# Altium schematic sheet 02_Power_Regulations.SchDoc
size A3; SheetNumber: 3; SheetTotal: 12
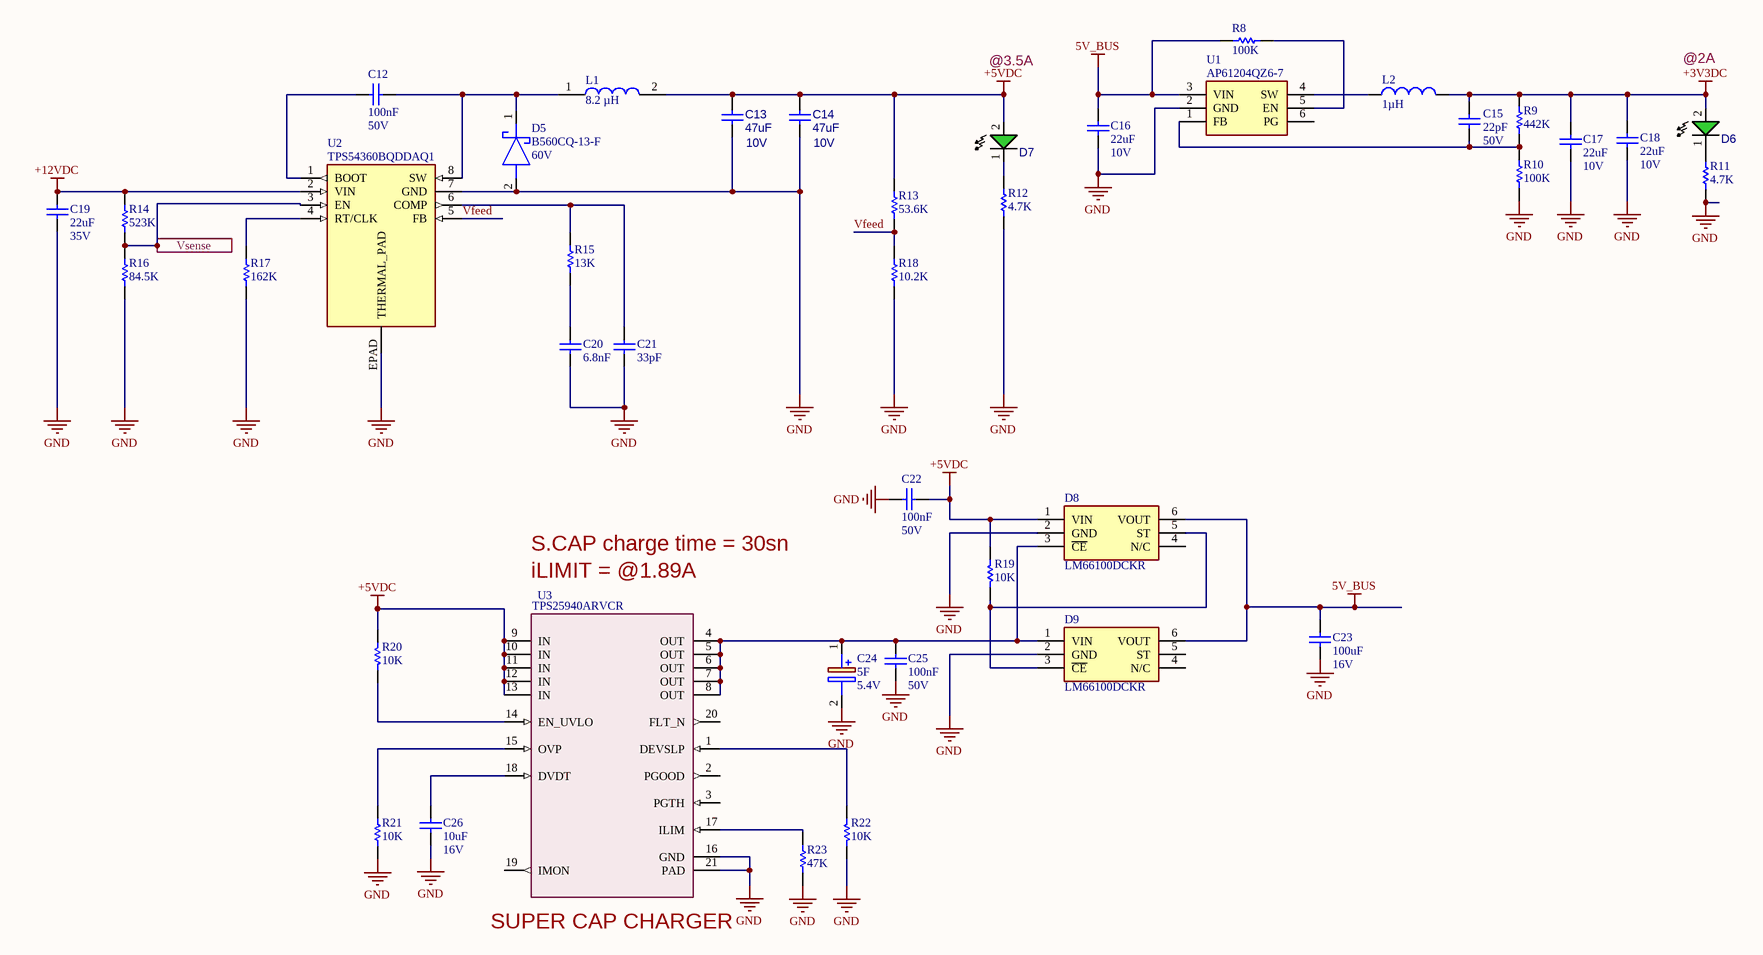
[diagram p0: 02_Power_Regulations.SchDoc]

## Parts
C12  value 100nF  Voltage: 50V  [CAP_0603]  (hidden comment: CAP)
C13  value 47uF  Voltage: 10V  [CAP_1206]  (hidden comment: CL31A476MPHNNNE)
C14  value 47uF  Voltage: 10V  [CAP_1206]  (hidden comment: CL31A476MPHNNNE)
C15  value 22pF  Voltage: 50V  [CAP_0603]  (hidden comment: CAP)
C16  value 22uF  Voltage: 10V  [CAP_0805]  (hidden comment: CL21A226MPCLRNC)
C17  value 22uF  Voltage: 10V  [CAP_0805]  (hidden comment: CL21A226MPCLRNC)
C18  value 22uF  Voltage: 10V  [CAP_0805]  (hidden comment: CL21A226MPCLRNC)
C19  value 22uF  Voltage: 35V  [CAP_0805]  (hidden comment: GMC21X5R226M35NT)
C20  value 6.8nF  [CAP_0603]  (hidden comment: CC0603KRX7R9BB682)
C21  value 33pF  [CAP_0603]  (hidden comment: CL10C330JB8NNNC)
C22  value 100nF  Voltage: 50V  [CAP_0603]  (hidden comment: CAP)
C23  value 100uF  Voltage: 16V  [CAP_1210]  (hidden comment: C1210C107M4PACTU)
C24  value 5F  Voltage: 5.4V  [DRML5R4505_horizonal]  (hidden comment: DRML5R4505)
C25  value 100nF  Voltage: 50V  [CAP_0603]  (hidden comment: CAP)
C26  value 10uF  Voltage: 16V  [CAP_0603]  (hidden comment: CL10A106MO8NQNC)
D5  B560CQ-13-F  value 60V  [DIOM7959X250N]
D6  LTST-C190TGKT  [LED_0603_GREEN]  (value not drawn)
D7  LTST-C190TGKT  [LED_0603_GREEN]  (value not drawn)
D8  LM66100DCKR  [SOP65P210X110-6N]
D9  LM66100DCKR  [SOP65P210X110-6N]
L1  value 8.2 µH  [7447797360]  (hidden comment: 7447797820)
L2  value 1µH  [FPI0302-2R2M]  (hidden comment: FPI0302-1R0M)
R8  value 100K  [RES_0603]  (hidden comment: RES)
R9  value 442K  [RES_0603]  (hidden comment: RES)
R10  value 100K  [RES_0603]  (hidden comment: RES)
R11  value 4.7K  [RES_0603]  (hidden comment: 0603SAF4701T5E)
R12  value 4.7K  [RES_0603]  (hidden comment: 0603SAF4701T5E)
R13  value 53.6K  [RES_0402]  (hidden comment: 0402WGF5362TCE)
R14  value 523K  [RES_0402]  (hidden comment: 0402WGF5233TCE)
R15  value 13K  [RES_0402]  (hidden comment: 0402WGF1302TCE)
R16  value 84.5K  [RES_0402]  (hidden comment: 0402WGF8452TCE)
R17  value 162K  [RES_0402]  (hidden comment: 0402WGF1623TCE)
R18  value 10.2K  [RES_0402]  (hidden comment: 0402WGF1022TCE)
R19  value 10K  [RES_0603]  (hidden comment: RES)
R20  value 10K  [RES_0603]  (hidden comment: RES)
R21  value 10K  [RES_0603]  (hidden comment: RES)
R22  value 10K  [RES_0603]  (hidden comment: RES)
R23  value 47K  [RES_0603]  (hidden comment: RES)
U1  AP61204QZ6-7  [AP61204QZ67]
U2  TPS54360BQDDAQ1  [DDA8_3P1X2P4_TEX]
U3  TPS25940ARVCR  [20-WFQFN Exposed Pad]

## Ports
Vsense (in)

## Nets
5V_BUS: C16.1 C23.2 D8.6(VOUT) D9.6(VOUT) R8.1 U1.3(VIN)
+3V3DC: C15.1 C17.1 C18.1 D6.2 L2.2 R9.1
+5VDC: C13.1 C14.1 C22.2 D7.2 D8.1(VIN) L1.2 R13.1 R19.1 R20.2 U3.9(IN) U3.10(IN) U3.11(IN) U3.12(IN) U3.13(IN)
+12VDC: C19.1 R14.2 U2.2(VIN)
GND: C13.2 C14.2 C16.2 C17.2 C18.2 C19.2 C20.2 C21.2 C22.1 C23.1 C24.2(-) C25.1 C26.1 D5.2(A) D8.2(GND) D9.2(GND) R10.1 R11.1 R12.1 R16.1 R17.1 R18.2 R21.2 R22.2 R23.2 U1.2(GND) U2.7(GND) U2.EPAD(THERMAL_PAD) U3.16(GND) U3.21(PAD)
Vfeed: R13.2 R18.1 U2.5(FB)
Vsense: R14.1 R16.2 U2.3(EN) ; port Vsense
NetC12_1: C12.1 U2.1(BOOT)
NetC12_2: C12.2 D5.1(K) L1.1 U2.8(SW)
NetC15_2: C15.2 R9.2 R10.2 U1.1(FB)
NetC20_1: C20.1 R15.1
NetC21_1: C21.1 R15.2 U2.6(COMP)
NetC24_1: C24.1(+) C25.2 D8.3(~{CE}) D9.1(VIN) U3.4(OUT) U3.5(OUT) U3.6(OUT) U3.7(OUT) U3.8(OUT)
NetC26_2: C26.2 U3.18(DVDT)
NetD6_1: D6.1 R11.2
NetD7_1: D7.1 R12.2
NetD8_5: D8.5(ST) D9.3(~{CE}) R19.2
NetL2_1: L2.1 U1.4(SW)
NetR8_2: R8.2 U1.5(EN)
NetR17_2: R17.2 U2.4(RT/CLK)
NetR20_1: R20.1 U3.14(EN_UVLO)
NetR21_1: R21.1 U3.15(OVP)
NetR22_1: R22.1 U3.1(DEVSLP)
NetR23_1: R23.1 U3.17(ILIM)

Not connected (* = marked no-connect by the designer): D8 4(N/C); D9 4(N/C) 5(ST); U1 6(PG); U3 2(PGOOD) 3(PGTH) 19(IMON) 20(FLT_N)

## Notes on the sheet
- @3.5A
- @2A
- iLIMIT = @1.89A
- S.CAP charge time = 30sn
- (near U3) SUPER CAP CHARGER
- Title
- Size:
- Date:
- 14.11.2019
- A3
- Number:
- Rev.Number:
- V1R0
- Revision:
- Drawer/
- Sheet
- of
- YALIM
- Burak
- File:

## Library data of the parts
C12 C22 C25 = C01763: CAP CER 100nF 50VDC %10 X7R SMD; Manufacturer: Samsung; Manufacturer Part Number: CL10B104KB8NNNL
C13 C14 = CL31A106KBHNNNE: MLCC (3216) 1206 47uF 10VDC ±20% X5R; Manufacturer: SAMSUNG; Package: 1206 (3216 Metric); Manufacturer Part Number: CL31A476MPHNNNE
C15 = C01769: MLCC 0603 22pF 50VDC ±5% C0G (NP0); Manufacturer: Samsung; Manufacturer Part Number: CL10C220JB8NNNC
C16-C18 = C01758: MLCC (2012) 0805 22uF 10VDC ±20% X5R; Manufacturer: Samsung; Manufacturer Part Number: CL21A226MPCLRNC
C19 = C01758: 22 µF ±20% 35V Ceramic Capacitor X5R 0805 (2012 Metric); Manufacturer: Cal-Chip Electronics, Inc.; Manufacturer Part Number: GMC21X5R226M35NT
C20 = CL10C330JB8NNNC: MLCC (1608) 0603 6.8nF 50VDC ±10% X7R; Manufacturer: YAGEO; Supplier 1: OZDISAN; Manufacturer Part Number: CC0603KRX7R9BB682
C21 = CL10C330JB8NNNC: MLCC (1608) 0603 33pF 50VDC ±5% C0G (NP0); Manufacturer: Samsung Electro-Mechanics America, Inc; Supplier 1: OZDISAN; Manufacturer Part Number: CL10C330JB8NNNC
C23 = C01763: MLCC (3225) 1210 100uF 16VDC ±20% X5R; Manufacturer: KEMET; Manufacturer Part Number: C1210C107M4PACTU
C24 = DRML5R4505: CAP.SUPER 5F 5.4V SIZE 20.5x10.0x26.0; Manufacturer: KORCHIP; Manufacturer Part Number: DRML5R4505
C26 = C01763: MLCC (1608) 0603 10uF 16VDC ±20% X5R; Manufacturer: Samsung; Manufacturer Part Number: CL10A106MO8NQNC
D5 = B560CQ-13-F: DIODE SCHOTTKY 60V 5A SMC; Manufacturer: Diodes Incorporated; Manufacturer Part Number: B560CQ-13-F
D6 D7 = LTST-C190TGKT: LED SMD 0603 GREEN 71-450mcd 130° WATER CLEAR; Manufacturer: LITEON; Package: 0603(1608 Metric); Manufacturer Part Number: LTST-C190TGKT; Value: GREEN
D8 D9 = LM66100DCKR: Diode; Manufacturer_Name: Texas Instruments; Datasheet Link: http://www.ti.com/lit/gpn/LM66100; Height: 1.1mm; Manufacturer_Part_Number: LM66100DCKR; Mouser Part Number: 595-LM66100DCKR; Mouser Price/Stock: https://www.mouser.co.uk/ProductDetail/Texas-Instruments/LM66100DCKR?qs=vLWxofP3U2y2yPPrXoBBoA%3D%3D; Arrow Part Number: LM66100DCKR; Arrow Price/Stock: https://www.arrow.com/en/products/lm66100dckr/texas-instruments.html?utm_currency=USD&region=nac
L1 = 7447797820: 8.2 µH Shielded Drum Core, Wirewound Inductor 5.05 A 28.6mOhm Max Nonstandard; Manufacturer: Wurth Elektronik; Manufacturer Part Number: 7447797820
L2 = IND0000019: INDUCTOR POWER 1UH 3.3X3MM SMD; Manufacturer: Core Master; Manufacturer Part Number: FPI0302-1R0M
R8 R10 = R03011: RES 0603 100K Ohms 1% 1/10W-S 100PPM; Manufacturer: ROYALOHM; Manufacturer Part Number: 0603SAF1003T5E
R9 = R03014: RES 0603 442K Ohms 1% 1/10W-S 100PPM; Manufacturer: ROYALOHM; Manufacturer Part Number: 0603SAF4423T5E
R11 R12 = 0603SAF4701T5E: RES.(1608) 0603 4.7K Ohms 1% 1/10W-S 100PPM; Manufacturer: ROYALOHM; Supplier 1: Ozdisan; Manufacturer Part Number: 0603SAF4701T5E
R13 = R03000: RES.(1005) 0402 53.6K Ohms 1% 1/16W 100PPM; Manufacturer: ROYALOHM; Manufacturer Part Number: 0402WGF5362TCE
R14 = R03000: RES.(1005) 0402 523K Ohms 1% 1/16W 100PPM; Manufacturer: ROYALOHM; Manufacturer Part Number: 0402WGF5233TCE
R15 = R03000: RES.(1005) 0402 13K Ohms 1% 1/16W 100PPM; Manufacturer: ROYALOHM; Manufacturer Part Number: 0402WGF1302TCE
R16 = R03000: RES.(1005) 0402 84.5K Ohms 1% 1/16W 100PPM; Manufacturer: ROYALOHM; Manufacturer Part Number: 0402WGF8452TCE
R17 = R03000: RES.(1005) 0402 162K Ohms 1% 1/16W 100PPM; Manufacturer: ROYALOHM; Manufacturer Part Number: 0402WGF1623TCE
R18 = R03000: RES.(1005) 0402 10.2K Ohms 1% 1/16W 100PPM; Manufacturer: ROYALOHM; Manufacturer Part Number: 0402WGF1022TCE
R19-R22 = R02995: RES 0603 10k Ohms %1 1/10W 100PPM; Manufacturer: ROYALOHM; Manufacturer Part Number: 0603SAF1002T5E
R23 = R03000: RES 0603 47K Ohms 1% 1/10W-S 100PPM; Manufacturer: ROYALOHM; Manufacturer Part Number: 0603SAF4702T5E
U1 = AP61204QZ6-7: Integrated Circuit; Manufacturer_Name: Diodes Incorporated; Datasheet Link: https://www.diodes.com/datasheet/download/AP61204Q.pdf; Height: 0.6mm; Manufacturer_Part_Number: AP61204QZ6-7
U2 = TPS54360BQDDAQ1: Automotive, 60V Input, 3.5A, Step-Down DC-DC Converter With Eco-mode&trade; 8-SO PowerPAD -40 to 125; Manufacturer: Texas Instruments; Copyright: Copyright (C) 2026 Ultra Librarian. All rights reserved.; Manufacturer Part Number: TPS54360BQDDAQ1; RefDes: RefDes; Type: Type
U3 = TPS25940ARVCR: IC ELECTRONIC FUSE 8% 20WQFN; Manufacturer: Texas Instruments; Value: TPS25940ARVCR; Manufacturer Part Number: TPS25940ARVCR